# Altium schematic sheet a0206-2006.16.SchDoc
size 558 x 431 mm
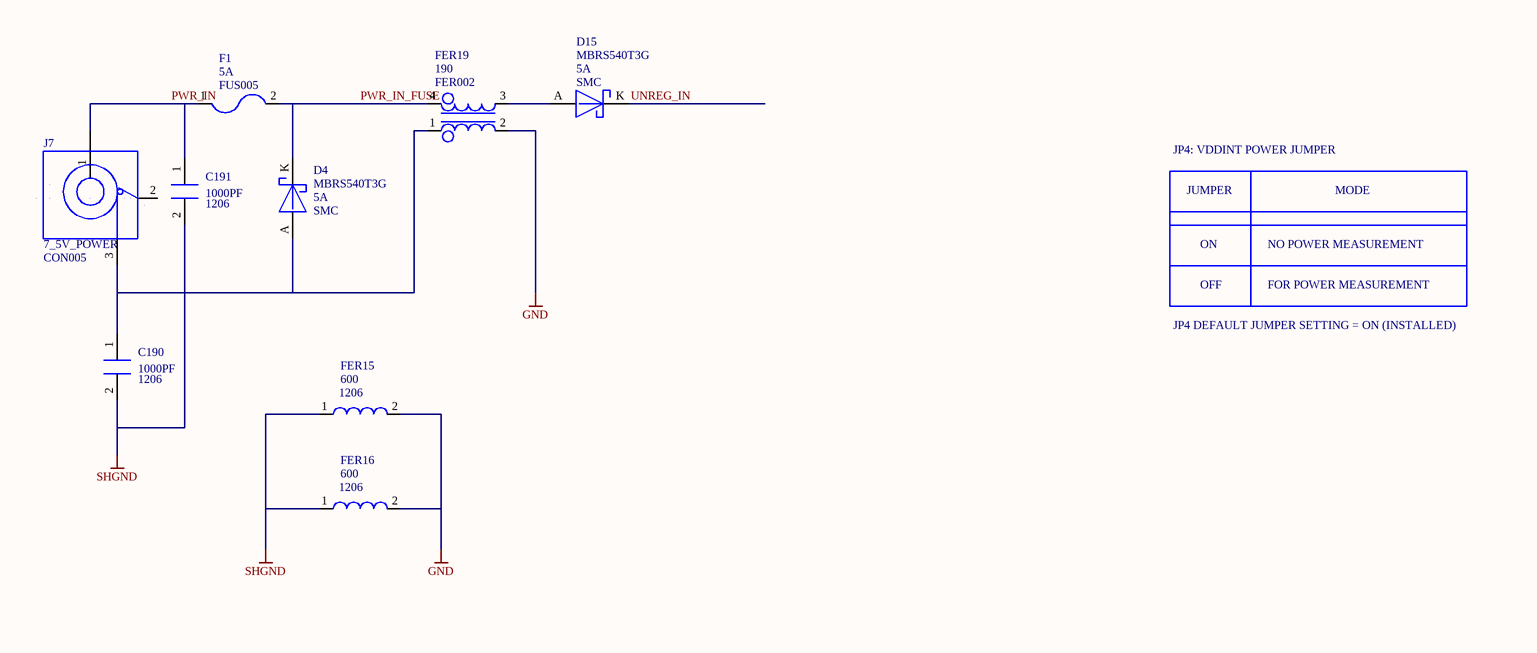
[diagram p0: a0206-2006.16.SchDoc, top left]
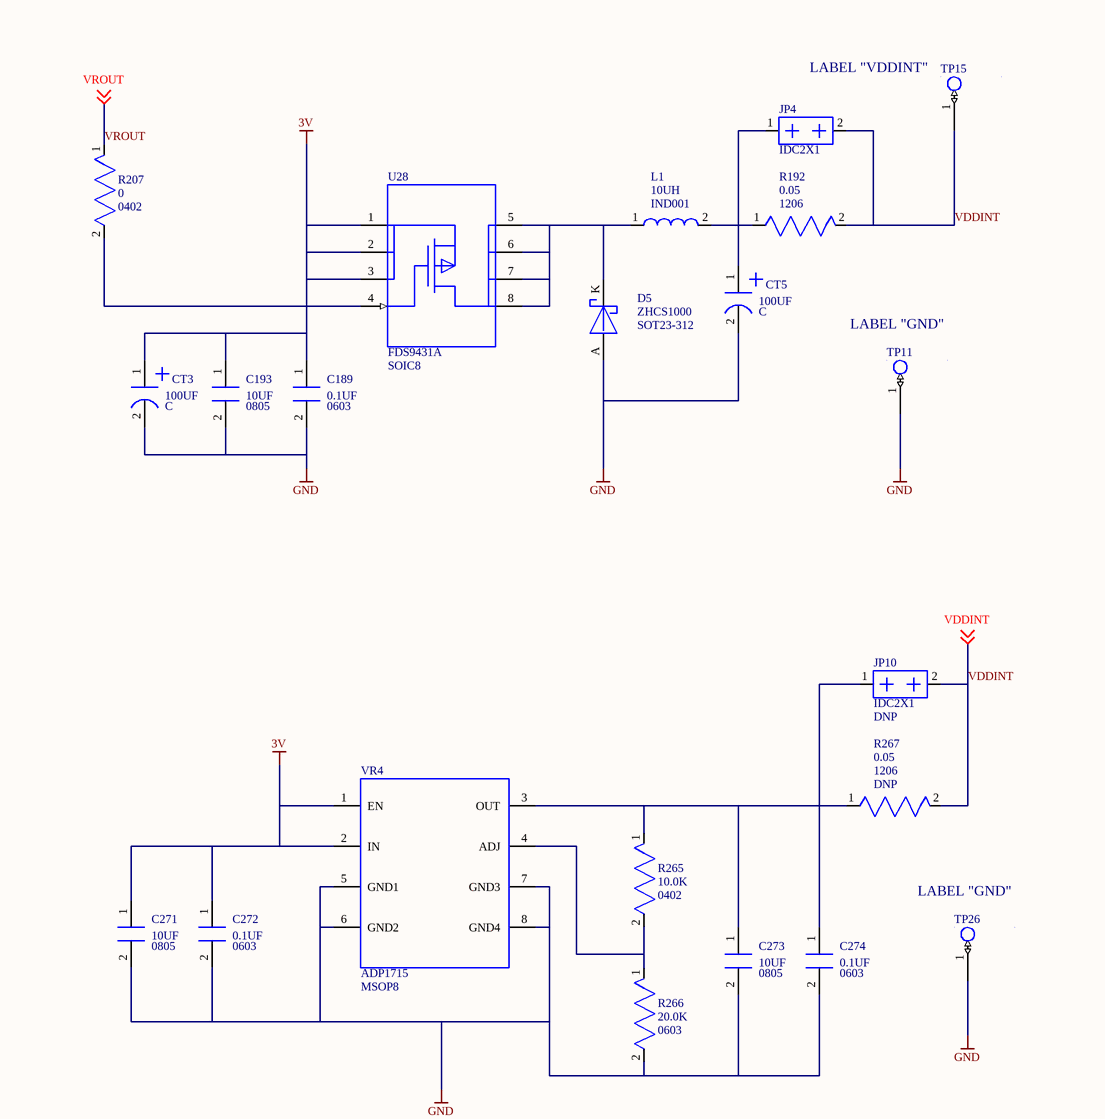
[diagram p1: a0206-2006.16.SchDoc, top right]
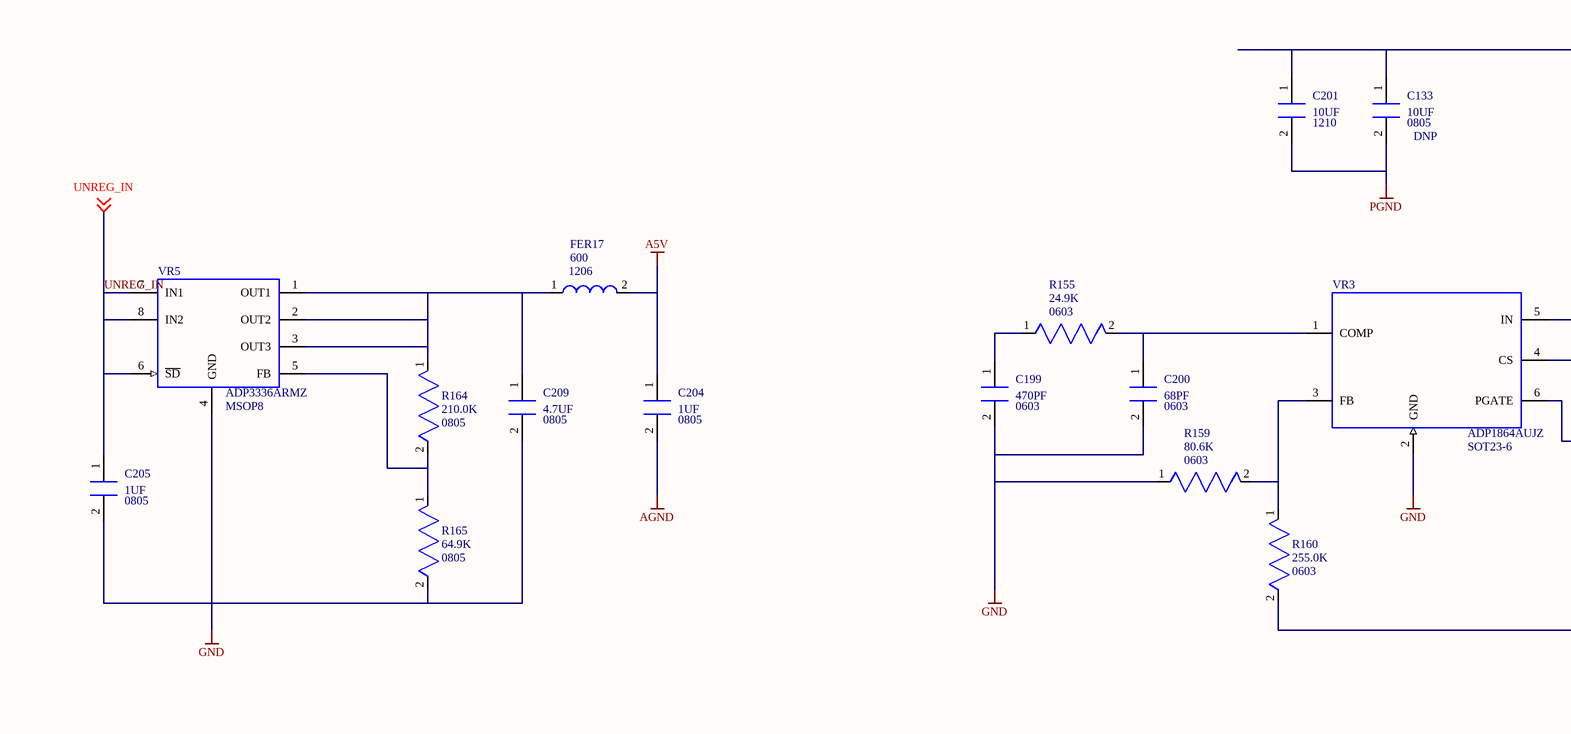
[diagram p2: a0206-2006.16.SchDoc, bottom left]
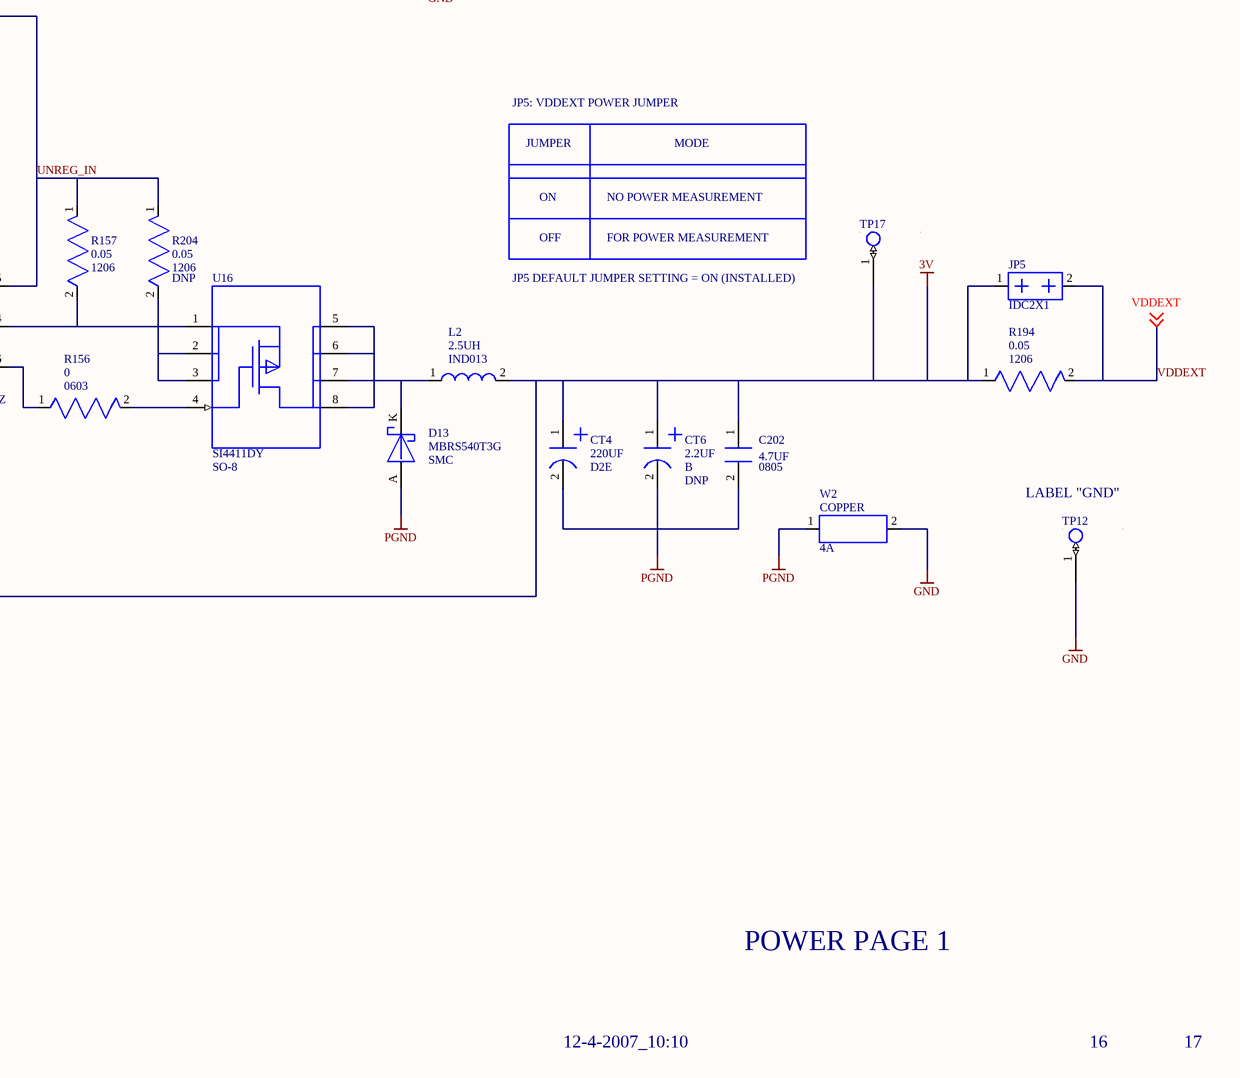
[diagram p3: a0206-2006.16.SchDoc, bottom right]

## Parts
C133  value 10UF  CLASS: DNP  [0805]  (hidden comment: *)
C189  value 0.1UF  [0603]  (hidden comment: *)
C190  value 1000PF  [1206]  (hidden comment: *)
C191  value 1000PF  [1206]  (hidden comment: *)
C193  value 10UF  [0805]  (hidden comment: *)
C199  value 470PF  [0603]  (hidden comment: *)
C200  value 68PF  [0603]  (hidden comment: *)
C201  value 10UF  [1210]  (hidden comment: *)
C202  value 4.7UF  [0805]  (hidden comment: *)
C204  value 1UF  [0805]  (hidden comment: *)
C205  value 1UF  [0805]  (hidden comment: *)
C209  value 4.7UF  [0805]  (hidden comment: *)
C271  value 10UF  [0805]  (hidden comment: *)
C272  value 0.1UF  [0603]  (hidden comment: *)
C273  value 10UF  [0805]  (hidden comment: *)
C274  value 0.1UF  [0603]  (hidden comment: *)
CT3  value 100UF  [C]  (hidden comment: *)
CT4  value 220UF  [D2E]  (hidden comment: *)
CT5  value 100UF  [C]  (hidden comment: *)
CT6  value 2.2UF  CLASS: DNP  [B]  (hidden comment: *)
D4  value 5A  PART: MBRS540T3G  [SMC]  (hidden comment: *)
D5  PART: ZHCS1000  [SOT23-312]  (hidden comment: *)
D13  PART: MBRS540T3G  [SMC]  (hidden comment: *)
D15  value 5A  PART: MBRS540T3G  [SMC]  (hidden comment: *)
F1  value 5A  [FUS005]  (hidden comment: *)
FER15  value 600  [1206]  (hidden comment: *)
FER16  value 600  [1206]  (hidden comment: *)
FER17  value 600  [1206]  (hidden comment: *)
FER19  value 190  [FER002]  (hidden comment: *)
J7  value 7_5V_POWER  [CON005]  (hidden comment: *)
JP4  *  [IDC2X1]  (value not drawn)
JP5  *  [IDC2X1]  (value not drawn)
JP10  CLASS: DNP  [IDC2X1]  (hidden comment: *)
L1  value 10UH  [IND001]  (hidden comment: *)
L2  value 2.5UH  [IND013]  (hidden comment: *)
R155  value 24.9K  [0603]  (hidden comment: *)
R156  value 0  [0603]  (hidden comment: *)
R157  value 0.05  [1206]  (hidden comment: *)
R159  value 80.6K  [0603]  (hidden comment: *)
R160  value 255.0K  [0603]  (hidden comment: *)
R164  value 210.0K  [0805]  (hidden comment: *)
R165  value 64.9K  [0805]  (hidden comment: *)
R192  value 0.05  [1206]  (hidden comment: *)
R194  value 0.05  [1206]  (hidden comment: *)
R204  value 0.05  CLASS: DNP  [1206]  (hidden comment: *)
R207  value 0  [0402]  (hidden comment: *)
R265  value 10.0K  [0402]  (hidden comment: *)
R266  value 20.0K  [0603]  (hidden comment: *)
R267  value 0.05  CLASS: DNP  [1206]  (hidden comment: *)
TP11  *  [TP]  (value not drawn)
TP12  *  [TP]  (value not drawn)
TP15  *  [TP]  (value not drawn)
TP17  *  [TP]  (value not drawn)
TP26  *  [TP]  (value not drawn)
U16  PART: SI4411DY  [SO-8]  (hidden comment: *)
U28  PART: FDS9431A  [SOIC8]  (hidden comment: *)
VR3  PART: ADP1864AUJZ  [SOT23-6]  (hidden comment: *)
VR4  PART: ADP1715  [MSOP8]  (hidden comment: *)
VR5  PART: ADP3336ARMZ  [MSOP8]  (hidden comment: *)
W2  value COPPER  [4A]  (hidden comment: *)

## Nets
3V: C189.1(A) C193.1(A) C202.1(A) C271.1(A) C272.1(A) CT3.1(P) CT4.1(P) CT6.1(P) JP5.1 L2.2(B) R160.2(N2) R194.1(N1) TP17.1(TP) U28.1(S1) U28.2(S2) U28.3(S3) VR4.1(EN) VR4.2(IN)
A5V: C204.1(A) FER17.2(B)
AGND: C204.2(B)
GND: C189.2(B) C193.2(B) C199.2(B) C200.2(B) C205.2(B) C209.2(B) C271.2(B) C272.2(B) C273.2(B) C274.2(B) CT3.2(N) CT5.2(N) D5.A(ANODE) FER15.2(B) FER16.2(B) FER19.2 R159.1(N1) R165.2(N2) R266.2(N2) TP11.1(TP) TP12.1(TP) TP26.1(TP) VR3.2(GND) VR4.5(GND1) VR4.6(GND2) VR4.7(GND3) VR4.8(GND4) VR5.4(GND) W2.2(N2)
PGND: C133.2(B) C201.2(B) C202.2(B) CT4.2(N) CT6.2(N) D13.A(ANODE) W2.1(N1)
SHGND: C190.2(B) C191.2(B) FER15.1(A) FER16.1(A)
PWR_IN: C191.1(A) F1.1(A) J7.1(CENTER)
PWR_IN_FUSE: D4.K(CATHODE) F1.2(B) FER19.4
UNREG_IN: C133.1(A) C201.1(A) C205.1(A) D15.K(CATHODE) R157.1(N1) R204.1(N1) VR3.5(IN) VR5.6(~{SD}) VR5.7(IN1) VR5.8(IN2) ; off-sheet UNREG_IN
VDDEXT: JP5.2 R194.2(N2) ; off-sheet VDDEXT
VDDINT: JP4.2 JP10.2 R192.2(N2) R267.2(N2) TP15.1(TP) ; off-sheet VDDINT
VROUT: R207.1(N1) ; off-sheet VROUT
NetC190_1: C190.1(A) D4.A(ANODE) FER19.1 J7.3(SHELL)
NetC199_1: C199.1(A) R155.1(N1)
NetC200_1: C200.1(A) R155.2(N2) VR3.1(COMP)
NetC209_1: C209.1(A) FER17.1(A) R164.1(N1) VR5.1(OUT1) VR5.2(OUT2) VR5.3(OUT3)
NetC273_1: C273.1(A) C274.1(A) JP10.1 R265.1(N1) R267.1(N1) VR4.3(OUT)
NetCT5_1: CT5.1(P) JP4.1 L1.2(B) R192.1(N1)
NetD5_K: D5.K(CATHODE) L1.1(A) U28.5(D1) U28.6(D2) U28.7(D3) U28.8(D4)
NetD13_K: D13.K(CATHODE) L2.1(A) U16.5(D1) U16.6(D2) U16.7(D3) U16.8(D4)
NetD15_A: D15.A(ANODE) FER19.3
NetR156_1: R156.1(N1) VR3.6(PGATE)
NetR156_2: R156.2(N2) U16.4(G)
NetR157_2: R157.2(N2) R204.2(N2) U16.1(S1) U16.2(S2) U16.3(S3) VR3.4(CS)
NetR159_2: R159.2(N2) R160.1(N1) VR3.3(FB)
NetR164_2: R164.2(N2) R165.1(N1) VR5.5(FB)
NetR207_2: R207.2(N2) U28.4(G)
NetR265_2: R265.2(N2) R266.1(N1) VR4.4(ADJ)

Not connected (* = marked no-connect by the designer): J7 2(N/C)

## Notes on the sheet
- LABEL "VDDINT"
- JP4: VDDINT POWER JUMPER
- JUMPER
- MODE
- OFF
- ON
- NO POWER MEASUREMENT
- FOR POWER MEASUREMENT
- JP4 DEFAULT JUMPER SETTING = ON (INSTALLED)
- (near TP11) LABEL "GND"
- (near TP26) LABEL "GND"
- JP5: VDDEXT POWER JUMPER
- JP5 DEFAULT JUMPER SETTING = ON (INSTALLED)
- (near TP12) LABEL "GND"
- POWER PAGE 1
- 12-4-2007_10:10
- 16
- 17
- A
- B
- C
- D
- 1
- 2
- 3
- 20 Cotton Road
- 4
- DEVICES
- ANALOG
- Nashua, NH 03063
- PH: 1-800-ANALOGD
- Title
- ADSP-BF548 EZ-KIT LITE
- Size
- Board No.
- A0206-2006
- Rev
- 1.4B
- Date
- Sheet
- of

## Library data of the parts
C133 C193 C273 = CAP_NON_POLARIZED.2: PART_SPEC: CAPACITOR; LEVEL: STD; TOLERANCE: 10%; VOLTAGE: 10V; TYPE: X5R CER; PRT_NUM: 7000461; PKG_TYPE: 0805; ROHS: ROHS
C189 C272 C274 = CAP_NON_POLARIZED.2: PART_SPEC: CAPACITOR; LEVEL: STD; TYPE: X7R; BOARDS: BOTH; PRT_NUM: 7000340; VOLTAGE: 16V; TOLERANCE: 10%; PKG_TYPE: 0603; ROHS: ROHS
C190 C191 = CAP_NON_POLARIZED.2: PART_SPEC: CAPACITOR; LEVEL: STD; TYPE: CERM; PRT_NUM: 7000502; VOLTAGE: 50V; TOLERANCE: 5%; PKG_TYPE: 1206; ROHS: ROHS
C199 = CAP_NON_POLARIZED.2: PART_SPEC: CAPACITOR; LEVEL: STD; TOLERANCE: 5%; VOLTAGE: 50V; TYPE: NPO; PRT_NUM: 7000352; PKG_TYPE: 0603; ROHS: ROHS
C200 = CAP_NON_POLARIZED.2: PART_SPEC: CAPACITOR; LEVEL: STD; TOLERANCE: 5%; VOLTAGE: 50V; TYPE: NPO; PRT_NUM: 7000348; PKG_TYPE: 0603; ROHS: ROHS
C201 = CAP_NON_POLARIZED.2: PART_SPEC: CAPACITOR; LEVEL: STD; TOLERANCE: 10%; VOLTAGE: 16V; TYPE: X5R; PRT_NUM: 7000492; PKG_TYPE: 1210; ROHS: ROHS
C202 = CAP_NON_POLARIZED.2: PART_SPEC: CAPACITOR; LEVEL: STD; TOLERANCE: 10%; VOLTAGE: 6.3V; TYPE: X5R; PRT_NUM: 7000275; PKG_TYPE: 0805; ROHS: ROHS
C204 C205 = CAP_NON_POLARIZED.2: PART_SPEC: CAPACITOR; LEVEL: STD; TYPE: X7R; TOLERANCE: 10%; VOLTAGE: 16V; PRT_NUM: 7000143; PKG_TYPE: 0805; ROHS: ROHS
C209 = CAP_NON_POLARIZED.2: PART_SPEC: CAPACITOR; LEVEL: STD; TYPE: X5R; TOLERANCE: 10%; VOLTAGE: 6.3V; PRT_NUM: 7000275; PKG_TYPE: 0805; ROHS: ROHS
C271 = CAP_NON_POLARIZED.2: PART_SPEC: CAPACITOR; LEVEL: STD; PRT_NUM: 7000461; TYPE: X5R CER; VOLTAGE: 10V; TOLERANCE: 10%; PKG_TYPE: 0805; ROHS: ROHS
CT3 = CAP_POLARIZED.3: PART_SPEC: CAPACITOR; LEVEL: STD; TOLERANCE: 10%; VOLTAGE: 10V; PRT_NUM: 7000303; BOARDS: BOTH; PKG_TYPE: C; TYPE: TANT-LOW-ESR; ROHS: ROHS
CT4 = CAP_POLARIZED.3: PART_SPEC: CAPACITOR; LEVEL: STD; TOLERANCE: 20%; VOLTAGE: 6.3V; PRT_NUM: 7000357; PKG_TYPE: D2E; ROHS: ROHS; TYPE: TANT
CT5 = CAP_POLARIZED.3: PART_SPEC: CAPACITOR; LEVEL: STD; BOARDS: BOTH; PRT_NUM: 7000303; VOLTAGE: 10V; TOLERANCE: 10%; PKG_TYPE: C; ROHS: ROHS; TYPE: TANT-LOW-ESR
CT6 = CAP_POLARIZED.3: PART_SPEC: CAPACITOR; LEVEL: STD; TOLERANCE: 10%; VOLTAGE: 35V; PRT_NUM: 7000078; PKG_TYPE: B; ROHS: ROHS; TYPE: TANT
D4 = DIO_SCHOTTKY.3: SCHOT_RECT; LEVEL: STD; PRT_NUM: 7000553; CURRENT: 5A; PKG_TYPE: SMC; ROHS: ROHS; WEB: http://www.onsemi.com/PowerSolutions/product.do?id
D5 = DIO_SCHOTTKY_3.3: SCHOTTKY; LEVEL: STD; CURRENT: 1A; BOARDS: BOTH; VALUE: 1A; PRT_NUM: 7000252; PKG_TYPE: SOT23-312; WEB: http://www.zetex.com/3.0/3-3-3.asp?pn; ROHS: ROHS
D13 = DIO_SCHOTTKY.3: SCHOT_RECT; LEVEL: STD; CURRENT: 5A; PRT_NUM: 7000553; PKG_TYPE: SMC; WEB: http://www.onsemi.com/PowerSolutions/product.do?id; ROHS: ROHS
D15 = DIO_SCHOTTKY.1: SCHOT_RECT; LEVEL: STD; PRT_NUM: 7000553; CURRENT: 5A; PKG_TYPE: SMC; ROHS: ROHS; WEB: http://www.onsemi.com/PowerSolutions/product.do?id
F1 = FUS_STANDARD.1: RESETABLE; PART_SPEC: FUSE; LEVEL: STD; PRT_NUM: 6000821; PKG_TYPE: FUS005; TYPE: RESETABLE; ROHS: ROHS
FER15 FER17 = FER_STANDARD.1: PART_SPEC: FERRITE; LEVEL: STD; FREQ: 100MHZ; PRT_NUM: 7000117; CURRENT: 500MA; PKG_TYPE: 1206; ROHS: ROHS
FER16 = FER_STANDARD.1: PART_SPEC: FERRITE; LEVEL: STD; FREQ: 100MHZ; CURRENT: 500MA; PRT_NUM: 7000117; PKG_TYPE: 1206; ROHS: ROHS
FER19 = FER_CHOKE.1: PART_SPEC: FERRITE; LEVEL: STD; FREQ: 100MHZ; PRT_NUM: 7000232; CURRENT: 5A; PKG_TYPE: FER002; ROHS: ROHS
J7 = CON_POWER.1: RA; PART_SPEC: CONNECTOR; LEVEL: STD; CONFIGURATION: 2.5MM_JACK; PRT_NUM: 6000018; PKG_TYPE: CON005; TYPE: PWR; ROHS: ROHS
JP4 JP5 = CON_2X1.2: HEADER; PART_SPEC: CONNECTOR; LEVEL: STD; PRT_NUM: 6000774; CONFIGURATION: 2X1; PKG_TYPE: IDC2X1; TYPE: IDC; ROHS: ROHS
JP10 = CON_2X1.2: HEADER; PART_SPEC: CONNECTOR; LEVEL: STD; CONFIGURATION: 2X1; PRT_NUM: 6000774; PKG_TYPE: IDC2X1; ROHS: ROHS; TYPE: IDC
L1 = IND_STANDARD.1: PART_SPEC: INDUCTOR; LEVEL: STD; TOLERANCE: 20%; RESISTANCE: 47; PRT_NUM: 7000212; BOARDS: BOTH; PKG_TYPE: IND001; ROHS: ROHS
L2 = IND_STANDARD.1: PART_SPEC: INDUCTOR; LEVEL: STD; TOLERANCE: 30%; PRT_NUM: 7000563; PKG_TYPE: IND013; ROHS: ROHS
R155 = RES_STANDARD.1: PART_SPEC: RESISTOR; LEVEL: STD; TOLERANCE: 1%; POWER: 1/10W; PRT_NUM: 7000453; PKG_TYPE: 0603; ROHS: ROHS
R156 = RES_STANDARD.1: PART_SPEC: RESISTOR; LEVEL: STD; TOLERANCE: 5%; POWER: 1/10W; PRT_NUM: 7000371; PKG_TYPE: 0603; ROHS: ROHS
R157 = RES_STANDARD.2: PART_SPEC: RESISTOR; LEVEL: STD; TOLERANCE: 1%; POWER: 1/2W; PRT_NUM: 7000486; PKG_TYPE: 1206; ROHS: ROHS
R159 = RES_STANDARD.1: PART_SPEC: RESISTOR; LEVEL: STD; TOLERANCE: 1%; POWER: 1/10W; PRT_NUM: 7000522; PKG_TYPE: 0603; ROHS: ROHS
R160 = RES_STANDARD.2: PART_SPEC: RESISTOR; LEVEL: STD; TOLERANCE: 1%; POWER: 1/10W; PRT_NUM: 7000521; PKG_TYPE: 0603; ROHS: ROHS
R164 = RES_STANDARD.2: PART_SPEC: RESISTOR; LEVEL: STD; POWER: 1/4W; PRT_NUM: 7000311; TOLERANCE: 1%; PKG_TYPE: 0805; ROHS: ROHS
R165 = RES_STANDARD.2: PART_SPEC: RESISTOR; LEVEL: STD; POWER: 1/10W; PRT_NUM: 7000309; TOLERANCE: 1%; PKG_TYPE: 0805; ROHS: ROHS
R192 = RES_STANDARD.1: PART_SPEC: RESISTOR; LEVEL: STD; TOLERANCE: 1%; POWER: 1/2W; PRT_NUM: 7000486; PKG_TYPE: 1206; ROHS: ROHS
R194 R267 = RES_STANDARD.1: PART_SPEC: RESISTOR; LEVEL: STD; PRT_NUM: 7000486; POWER: 1/2W; TOLERANCE: 1%; PKG_TYPE: 1206; ROHS: ROHS
R204 = RES_STANDARD.2: PART_SPEC: RESISTOR; LEVEL: STD; PRT_NUM: 7000486; POWER: 1/2W; TOLERANCE: 1%; PKG_TYPE: 1206; ROHS: ROHS
R207 = RES_STANDARD.2: PART_SPEC: RESISTOR; LEVEL: STD; POWER: 1/16W; TOLERANCE: 5%; PRT_NUM: 7000282; BOARDS: BOTH; PKG_TYPE: 0402; ROHS: ROHS
R265 = RES_STANDARD.2: PART_SPEC: RESISTOR; LEVEL: STD; TOLERANCE: 1%; PRT_NUM: 7000582; POWER: 1/16W; PKG_TYPE: 0402; ROHS: ROHS
R266 = RES_STANDARD.2: PART_SPEC: RESISTOR; LEVEL: STD; TOLERANCE: 1%; PRT_NUM: 7000464; POWER: 1/16W; PKG_TYPE: 0603; ROHS: ROHS
TP11 TP12 TP15 TP26 = MSC_TEST_POINT.1: TESTPOINT; CLASS: DNP; LEVEL: STD; BOARDS: BOTH; PART_SPEC: TESTPOINT; PART: TESTPOINT; ROHS: ROHS; PKG_TYPE: TP
TP17 = MSC_TEST_POINT.1: TESTPOINT; CLASS: DNP; LEVEL: STD; PART_SPEC: TESTPOINT; PART: TESTPOINT; ROHS: ROHS; PKG_TYPE: TP
U16 = ICS_NDS8434A.1: P_CHANNEL MOSFET; LEVEL: STD; PRT_NUM: 1000419; PKG_TYPE: SO-8; WEB: http://www.vishay.com/product?docid; ROHS: ROHS
U28 = ICS_NDS8434A.1: 2.5V P-MOSFET; LEVEL: STD; BOARDS: BOTH; PRT_NUM: 1000318; PKG_TYPE: SOIC8; WEB: http://www.fairchildsemi.com/pf/FD/FDS9431A.html; ROHS: ROHS
VR3 = ICS_ADP1864.1: 3-14V IN STEPDOWN CONVERT; LEVEL: STD; PRT_NUM: 30-025758-01; PKG_TYPE: SOT23-6; WEB: http://www.analog.com/en/prod/0%2C2877%2CADP1864%2C00.html; ROHS: ROHS
VR4 = ICS_ADP1715.1: ADJ 500MA REG 0.8V TO 5V; LEVEL: STD; PRT_NUM: 30-025764-01; PKG_TYPE: MSOP8; WEB: http://www.analog.com/en/prod/0%2C2877%2CADP1715%2C00.html; ROHS: ROHS
VR5 = ICS_ADP3336.1: ADJ 500MA REGULATOR; LEVEL: STD; PRT_NUM: 30-025190-01; PKG_TYPE: MSOP8; ROHS: ROHS; WEB: HTTP://WWW.ANALOG.COM/EN/PROD/0%2C2877%2CADP3336%2C00.HTML
W2 = MSC_COPPER.1: LEVEL: STD; CLASS: DNP; PKG_TYPE: 4A